# Altium schematic sheet Power.SchDoc
size A4; SheetNumber: 3; SheetTotal: 4
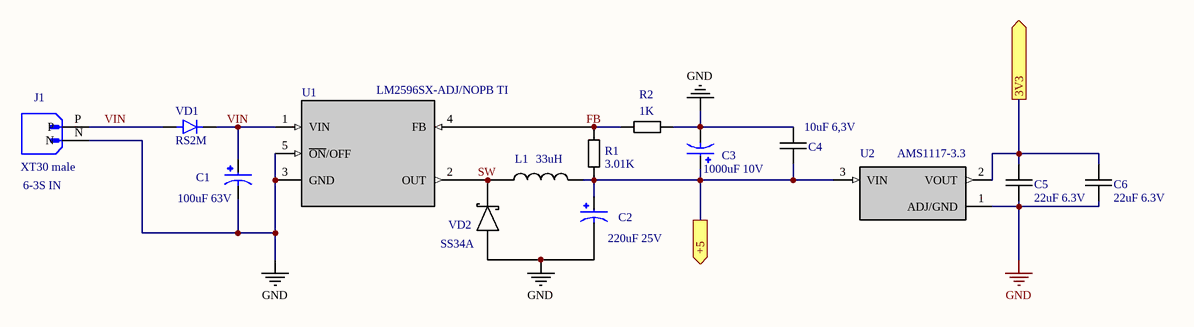
[diagram p0: Power.SchDoc]

## Parts
C1  100uF 63V  [C_POL_D10_P5]
C2  220uF 25V  [C_POL_D8_P3.5]
C3  1000uF 10V  [C_POL_D8_P3.5]
C4  10uF 6,3V  [C_0603]
C5  22uF 6.3V  [C_0603]
C6  22uF 6.3V  [C_0603]
J1  XT30 male  [XT30PW-M]
L1  33uH  [L_SND0705]
R1  3.01K  [R0603]
R2  1K  [R0603]
U1  LM2596SX-ADJ/NOPB TI  [LM2596SX-ADJ/NOPB]
U2  AMS1117-3.3  [LDO_SOT223]
VD1  RS2M  [VD_DO-214AA]
VD2  SS34A  [D_SCH_SS34A]

## Ports
3V3 (out, see Main[2B], MCU[1B]), +5 (out, see Main[2B], i_O[2B])

## Nets
GND: C1.N C2.N C3.N C4.2 C5.1 C6.1 J1.N R2.2 U1.3(GND) U1.5(~{ON}/OFF) U2.1(ADJ/GND) VD2.A
3V3: C5.2 C6.2 U2.2(VOUT) ; port 3V3
+5: C2.P C3.P C4.1 L1.2 R1.1 U2.3(VIN) ; port +5
FB: R1.2 R2.1 U1.4(FB)
SW: L1.1 U1.2(OUT) VD2.K
VIN: C1.P J1.P U1.1(VIN) VD1.A VD1.C(K)

## Notes on the sheet
- (near J1) 6-3S IN

## Library data of the parts
C1 = 100uF 63V EHR 10x13mm: 100uF 63V EHR 10x13mm (EHR101M63B-Hitano)  Electrolytic; MP: EEUFR1J101LB; MF: Hitano; Component Link 1 Description: Datasheet; Package: RADIAL-2 Panasonic; Value: *; SnapEDA_Link: https://www.snapeda.com/parts/EEUFR1J101LB/Panasonic/view-part/?ref=snap; Price: None; Availability: In Stock; Check_prices: https://www.snapeda.com/parts/EEUFR1J101LB/Panasonic/view-part/?ref=eda; Part Number: 100uF 63V EHR 10x13mm; MPN: EHR101M63B-Hitano; Capacitance: 100uF; Voltage: 63V; Category: Electrolytic; Supplier 1: rcscomponents; Supplier Part Number 1: 50458; Supplier Link 1: https://www.rcscomponents.kiev.ua/product/100uf-63v-ehr-10x13mm-ehr101m63b-hitano-elektrolitychnyi-kondensator_50458.html; Component Link 1 URL: https://www.rcscomponents.kiev.ua/datasheets/EHR_081225.pdf
C2 = 220uF 25V RTE 8x11,5mm (low esr): 220uF 25V RTE 8x11,5mm (low esr) (RTE1E221M0812-LEAGUER) Electrolytic; MP: EEUFR1J101LB; Component Link 1 Description: Datasheet; Package: RADIAL-2 Panasonic; Value: *; SnapEDA_Link: https://www.snapeda.com/parts/EEUFR1J101LB/Panasonic/view-part/?ref=snap; Price: None; Availability: In Stock; MF: LEAGUER; Check_prices: https://www.snapeda.com/parts/EEUFR1J101LB/Panasonic/view-part/?ref=eda; Part Number: 220uF 25V RTE 8x11,5mm (low esr); MPN: RTE1E221M0812-LEAGUER; Capacitance: 220uF; Voltage: 25V; ESR: low; Category: Electrolytic; Supplier 1: rcscomponents; Supplier Part Number 1: 180534; Supplier Link 1: https://www.rcscomponents.kiev.ua/product/220uf-25v-rte-8x11-5mm-low-esr-rte1e221m0812-leaguer-elektrolitychnyi-kondensator-nyzkoimpedansnyi_180534.html; Component Link 1 URL: https://www.rcscomponents.kiev.ua/datasheets/leaguer-rte_series-datasheet.pdf
C3 = 1000uF 10V RT1 8x12mm: 1000uF 10V RT1 8x12mm +105°С; MPN: RT11A102M0812; MP: EEUFR1J101LB; MF: Leaguer; Dielectric: electrolit; Component Link 1 Description: Datasheet; Package: RADIAL-2 Panasonic; Value: *; SnapEDA_Link: https://www.snapeda.com/parts/EEUFR1J101LB/Panasonic/view-part/?ref=snap; Price: None; Availability: In Stock; Check_prices: https://www.snapeda.com/parts/EEUFR1J101LB/Panasonic/view-part/?ref=eda; Part Number: 1000uF 10V RT1 8x12mm; Capacitance: 1000uF; Voltage: 10V; Category: Pol electrolit; Supplier 1: rcscomponents; Supplier Part Number 1: 124893; Supplier Link 1: https://www.rcscomponents.kiev.ua/product/1000uf-10v-rt1-8x12mm-rt11a102m0812-leaguer-elektrolitychnyi-kondensator_124893.html; Component Link 1 URL: https://www.rcscomponents.kiev.ua/datasheets/ke47003518x36t-datasheet.pdf
C4 = 10uF 6,3V X5R 20% 0603: MPN: C0603X106M063NT; Voltage: 6.3V; Tolerance: 0.2; MF: Hitano; Component Link 1 Description: Datasheet; Part Number: 10uF 6,3V X5R 20% 0603; Capacitance: 10uF; Dielectric: X5R; Category: Ceramic Capacitor; Supplier 1: rcscomponents; Supplier Part Number 1: 50744; Supplier Link 1: https://www.rcscomponents.kiev.ua/product/10uf-6-3v-x5r-20-0603-4k-reel-c0603x106m063nt-hitano-kondensator-keramichnyi-smd_50744.html; Component Link 1 URL: https://www.rcscomponents.kiev.ua/datasheets/X7R_X5R.pdf
C5 C6 = 22uF 6,3V X5R 20% 0603: MPN: CL10A226MQ8NRNC; Tolerance: 0.2; MF: Samsung; Component Link 1 Description: Datasheet; Part Number: 22uF 6,3V X5R 20% 0603; Capacitance: 22uF; Voltage: 6.3V; Dielectric: X5R; Category: Ceramic Capacitor; Supplier 1: rcscomponents; Supplier Part Number 1: 128028; Supplier Link 1: https://www.rcscomponents.kiev.ua/product/22uf-6-3v-x5r-20-0603-cl10a226mq8nrnc-samsung_128028.html; Component Link 1 URL: https://www.rcscomponents.kiev.ua/datasheets/cl_series_mlcc_datasheet.pdf
J1 = XT30PW-M: Socket; DC supply; XT30; male; PIN: 2; on PCBs; THT; Colour: yellow; MF: AMASS; SnapEDA_Link: https://www.snapeda.com/parts/XT30PW-M/AMASS/view-part/?ref=snap; Package: None; Value: *; MP: XT30PW-M; Check_prices: https://www.snapeda.com/parts/XT30PW-M/AMASS/view-part/?ref=eda; Part Number: XT30PW-M; MPN: XT30PW-M; Supplier 1: IMRAD; Supplier Part Number 1: 395565; Supplier Link 1: https://imrad.com.ua/ru/xt30pw-m
L1 = 33uH, ±20%, 1.2A, 0.13 Ohm: SND0705-330M (33uH, ±20%, 1.2A, 0.13 Ohm, SMD: 7.8x7.0mm, h=5.0mm) Anla Tech; MP: B82472P6472M000; MF: AnlaTech/IH; Inductance: 33 µH; DCR: 0.13 Ω; Component Link 1 Description: Datasheet; Price: None; Value: *; Package: None; Purchase-URL: https://pricing.snapeda.com/search/part/B82472P6472M000/?ref=eda; SnapEDA_Link: https://www.snapeda.com/parts/B82472P6472M000/TDK/view-part/?ref=snap; Check_prices: https://www.snapeda.com/parts/B82472P6472M000/TDK/view-part/?ref=eda; Availability: In Stock; Part Number: 33uH, ±20%, 1.2A, 0.13 Ohm; MPN: SND0705-330M; Current: 1.2A; Tolerance: ±20%; Category: Power Inductor; Supplier 1: rcscomponents; Supplier Part Number 1: 39225; Supplier Link 1: https://www.rcscomponents.kiev.ua/product/snd0705-330m-33uh-20-1-2a-0-13-ohm-smd-7-8x7-0mm-h-5-0mm-anla-tech-drosel-sylovyi_39225.html; Component Link 1 URL: https://www.rcscomponents.kiev.ua/datasheets/SND-1.pdf
R1 = R0603 3.01K 1% 0.1W: R0603 3.01K 1% 0.1W Hitano; MPN: RC0603FR-3K01R; Tolerance: 0.01; Voltage: 50V; TCR: ±100 ppm/°C; Component Link 1 Description: Datasheet; Part Number: R0603 3.01K 1% 0.1W; Resistance: 3.01K; Power: 0.1W; Category: Thick Film Resistor; MF: Hitano; Supplier 1: rcscomponents; Supplier Part Number 1: 27651; Supplier Link 1: https://www.rcscomponents.kiev.ua/product/3-01-kohm-1-0-1w-50v-0603-rc0603fr-3k01r-hitano-rezystor-smd_27651.html; Component Link 1 URL: https://www.rcscomponents.kiev.ua/datasheets/RC0603HIT.pdf
R2 = R0603 1K 1% 0.1W: R0603 1K 1% 0.1W YAGEO; MPN: RC0603FR-071KL; Power: 1/10W; Tolerance: 0.01; Voltage: 75V; TCR: ±100 ppm/°C; Component Link 1 Description: Datasheet; Part Number: R0603 1K 1% 0.1W; Resistance: 1k; Category: Thick Film Resistor; MF: YAGEO; Supplier 1: rcscomponents; Supplier Part Number 1: 182684; Supplier Link 1: https://www.rcscomponents.kiev.ua/product/1-kohm-1-0-1w-75v-0603-rc0603fr-071kl-yageo-rezystor-smd_182684.html; Component Link 1 URL: https://www.rcscomponents.kiev.ua/datasheets/rc0603-272842.pdf
U1 = LM2596SX-ADJ/NOPB: DC/DC Buck Converter IC; MF: Texas Instruments; VIN: 4.5–40V; VOUT: 1.23–37 V, Adjustable; IOUT: 3A; Frequency: 150 kHz; Component Link 1 Description: Datasheet; SnapEDA_Link: https://www.snapeda.com/parts/LM2596SX-ADJ/NOPB/Texas+Instruments/view-part/?ref=snap; Package: TO-263-5 Texas Instruments; Value: *; MP: LM2596SX-ADJ/NOPB; Check_prices: https://www.snapeda.com/parts/LM2596SX-ADJ/NOPB/Texas+Instruments/view-part/?ref=eda; Part Number: LM2596SX-ADJ/NOPB; MPN: LM2596SX-ADJ/NOPB; Type: Adjustable; Category: Buck Converter (SMD); Supplier 1: rcscomponents; Supplier Part Number 1: 61180; Supplier Link 1: https://www.rcscomponents.kiev.ua/product/lm2596sx-adj-nopb_61180.html; Component Link 1 URL: https://www.ti.com/general/docs/suppproductinfo.tsp?distId=10&gotoUrl=http%3A%2F%2Fwww.ti.com%2Flit%2Fgpn%2Flm2596
U2 = LDO_SOT223_3V3: Linear Voltage Regulator IC Positive Fixed 1 Output 1A SOT-223-3L; MF: Multiple; VOUT: 3.3V; VIN (Max): 15V; Dropout: 1.1V; Component Link 1 Description: Datasheet; SnapEDA_Link: https://www.snapeda.com/parts/AMS1117-3.3/UMW/view-part/?ref=snap; Package: SOT-223-3L UMW; Value: *; MP: AMS1117-3.3; Check_prices: https://www.snapeda.com/parts/AMS1117-3.3/UMW/view-part/?ref=eda; Part Number: LDO_SOT223_3V3; MPN: AMS1117-3.3; IOUT: 1A; Output Type: Fixed; Category: LDO Regulator (SMD); Supplier 1: rcscomponents; Supplier Part Number 1: 87031; Supplier Link 1: https://www.rcscomponents.kiev.ua/product/ams1117-3-3_87031.html; Component Link 1 URL: https://mm.digikey.com/Volume0/opasdata/d220001/medias/docus/7158/5272_AMS1117-3.3.pdf
VD1 = RS2M MIC: Vf 1.3 / I2A / 1000V; MF: MIC; IF: 2A; VF: 1.3V; Component Link 1 Description: Datasheet; Package: DO-214AA-2 Taiwan Semiconductor; Price: None; Value: *; SnapEDA_Link: https://www.snapeda.com/parts/RS2M/Taiwan+Semiconductor/view-part/?ref=snap; MP: RS2M; Availability: In Stock; Check_prices: https://www.snapeda.com/parts/RS2M/Taiwan+Semiconductor/view-part/?ref=eda; Part Number: RS2M MIC; MPN: RS2M MIC; VRRM: 1000V; Category: Diode; Supplier 1: rcscomponents; Supplier Part Number 1: 182600; Supplier Link 1: https://www.rcscomponents.kiev.ua/product/rs2m_182600.html; Component Link 1 URL: https://www.rcscomponents.kiev.ua/product/rs2m_182600.html
VD2 = SS34A: Vrrm 40V / If 3А / Vf0,5V / Ifsm80A; IF: 3A; VF: 0.5V; IFSM: 80A; MF: Hottech; Component Link 1 Description: Datasheet; Part Number: SS34A; MPN: SS34A; VRRM: 40V; Category: Schottky Diode; Supplier 1: rcscomponents; Supplier Part Number 1: 199953; Supplier Link 1: https://www.rcscomponents.kiev.ua/product/ss34a_199953.html; Component Link 1 URL: https://www.rcscomponents.kiev.ua/datasheets/2204281430_Guangdong-Hottech-SS34A_C2886580.pdf